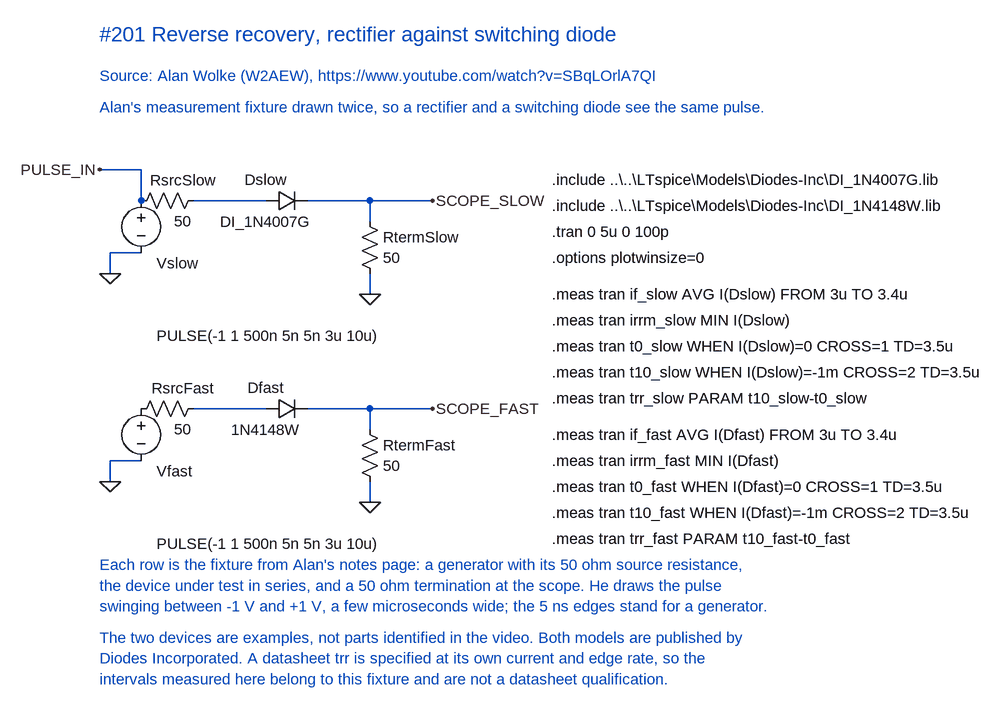
[diagram p0: schematic Reverse recovery rectifier versus switching diode.asc]
Reverse recovery rectifier versus switching diode.asc, the LTspice schematic file:
Version 4
SHEET 1 1500 900
WIRE 208 256 208 208
WIRE 208 208 144 208
WIRE 288 256 400 256
WIRE 464 256 560 256
WIRE 560 256 560 288
WIRE 560 256 656 256
WIRE 208 336 160 336
WIRE 160 336 160 368
WIRE 560 368 560 400
WIRE 288 576 400 576
WIRE 464 576 560 576
WIRE 560 576 560 608
WIRE 560 576 656 576
WIRE 208 656 160 656
WIRE 160 656 160 688
WIRE 560 688 560 720
FLAG 160 368 0
FLAG 560 400 0
FLAG 160 688 0
FLAG 560 720 0
FLAG 144 208 PULSE_IN
FLAG 656 256 SCOPE_SLOW
FLAG 656 576 SCOPE_FAST
SYMBOL voltage 208 240 R0
WINDOW 0 24 112 Left 2
WINDOW 3 24 224 Left 2
SYMATTR InstName Vslow
SYMATTR Value PULSE(-1 1 500n 5n 5n 3u 10u)
SYMBOL res 304 240 R90
WINDOW 0 0 32 VBottom 2
WINDOW 3 32 32 VTop 2
SYMATTR InstName RsrcSlow
SYMATTR Value 50
SYMBOL diode 400 272 R270
WINDOW 0 64 0 VBottom 2
WINDOW 3 -32 0 VTop 2
SYMATTR InstName Dslow
SYMATTR Value DI_1N4007G
SYMBOL res 544 272 R0
WINDOW 0 36 40 Left 2
WINDOW 3 36 72 Left 2
SYMATTR InstName RtermSlow
SYMATTR Value 50
SYMBOL voltage 208 560 R0
WINDOW 0 24 112 Left 2
WINDOW 3 24 224 Left 2
SYMATTR InstName Vfast
SYMATTR Value PULSE(-1 1 500n 5n 5n 3u 10u)
SYMBOL res 304 560 R90
WINDOW 0 0 32 VBottom 2
WINDOW 3 32 32 VTop 2
SYMATTR InstName RsrcFast
SYMATTR Value 50
SYMBOL diode 400 592 R270
WINDOW 0 64 0 VBottom 2
WINDOW 3 -32 0 VTop 2
SYMATTR InstName Dfast
SYMATTR Value 1N4148W
SYMBOL res 544 592 R0
WINDOW 0 36 40 Left 2
WINDOW 3 36 72 Left 2
SYMATTR InstName RtermFast
SYMATTR Value 50
TEXT 144 0 Left 3 ;#201 Reverse recovery, rectifier against switching diode
TEXT 144 64 Left 2 ;Source: Alan Wolke (W2AEW), https://www.youtube.com/watch?v=SBqLOrlA7QI
TEXT 144 112 Left 2 ;Alan's measurement fixture drawn twice, so a rectifier and a switching diode see the same pulse.
TEXT 144 816 Left 2 ;Each row is the fixture from Alan's notes page: a generator with its 50 ohm source resistance,
TEXT 144 848 Left 2 ;the device under test in series, and a 50 ohm termination at the scope. He draws the pulse
TEXT 144 880 Left 2 ;swinging between -1 V and +1 V, a few microseconds wide; the 5 ns edges stand for a generator.
TEXT 144 928 Left 2 ;The two devices are examples, not parts identified in the video. Both models are published by
TEXT 144 960 Left 2 ;Diodes Incorporated. A datasheet trr is specified at its own current and edge rate, so the
TEXT 144 992 Left 2 ;intervals measured here belong to this fixture and are not a datasheet qualification.
TEXT 840 224 Left 2 !.include ..\..\LTspice\Models\Diodes-Inc\DI_1N4007G.lib
TEXT 840 264 Left 2 !.include ..\..\LTspice\Models\Diodes-Inc\DI_1N4148W.lib
TEXT 840 304 Left 2 !.tran 0 5u 0 100p
TEXT 840 344 Left 2 !.options plotwinsize=0
TEXT 840 400 Left 2 !.meas tran if_slow AVG I(Dslow) FROM 3u TO 3.4u
TEXT 840 440 Left 2 !.meas tran irrm_slow MIN I(Dslow)
TEXT 840 480 Left 2 !.meas tran t0_slow WHEN I(Dslow)=0 CROSS=1 TD=3.5u
TEXT 840 520 Left 2 !.meas tran t10_slow WHEN I(Dslow)=-1m CROSS=2 TD=3.5u
TEXT 840 560 Left 2 !.meas tran trr_slow PARAM t10_slow-t0_slow
TEXT 840 616 Left 2 !.meas tran if_fast AVG I(Dfast) FROM 3u TO 3.4u
TEXT 840 656 Left 2 !.meas tran irrm_fast MIN I(Dfast)
TEXT 840 696 Left 2 !.meas tran t0_fast WHEN I(Dfast)=0 CROSS=1 TD=3.5u
TEXT 840 736 Left 2 !.meas tran t10_fast WHEN I(Dfast)=-1m CROSS=2 TD=3.5u
TEXT 840 776 Left 2 !.meas tran trr_fast PARAM t10_fast-t0_fast

The netlist it stands for:
* Reverse recovery rectifier versus switching diode.asc
Vslow PULSE_IN 0 PULSE(-1 1 500n 5n 5n 3u 10u)
RsrcSlow N001 PULSE_IN 50
Dslow N001 SCOPE_SLOW DI_1N4007G
RtermSlow SCOPE_SLOW 0 50
Vfast P001 0 PULSE(-1 1 500n 5n 5n 3u 10u)
RsrcFast N002 P001 50
Dfast N002 SCOPE_FAST 1N4148W
RtermFast SCOPE_FAST 0 50
.model D D
.lib standard.dio
* #201 Reverse recovery, rectifier against switching diode
* Source: Alan Wolke (W2AEW), https://www.youtube.com/watch?v=SBqLOrlA7QI
* Alan's measurement fixture drawn twice, so a rectifier and a switching diode see the same pulse.
* Each row is the fixture from Alan's notes page: a generator with its 50 ohm source resistance,
* the device under test in series, and a 50 ohm termination at the scope. He draws the pulse
* swinging between -1 V and +1 V, a few microseconds wide; the 5 ns edges stand for a generator.
* The two devices are examples, not parts identified in the video. Both models are published by
* Diodes Incorporated. A datasheet trr is specified at its own current and edge rate, so the
* intervals measured here belong to this fixture and are not a datasheet qualification.
.include ..\..\LTspice\Models\Diodes-Inc\DI_1N4007G.lib
.include ..\..\LTspice\Models\Diodes-Inc\DI_1N4148W.lib
.tran 0 5u 0 100p
.options plotwinsize=0
.meas tran if_slow AVG I(Dslow) FROM 3u TO 3.4u
.meas tran irrm_slow MIN I(Dslow)
.meas tran t0_slow WHEN I(Dslow)=0 CROSS=1 TD=3.5u
.meas tran t10_slow WHEN I(Dslow)=-1m CROSS=2 TD=3.5u
.meas tran trr_slow PARAM t10_slow-t0_slow
.meas tran if_fast AVG I(Dfast) FROM 3u TO 3.4u
.meas tran irrm_fast MIN I(Dfast)
.meas tran t0_fast WHEN I(Dfast)=0 CROSS=1 TD=3.5u
.meas tran t10_fast WHEN I(Dfast)=-1m CROSS=2 TD=3.5u
.meas tran trr_fast PARAM t10_fast-t0_fast
.backanno
.end